# Altium project li-ion-18650-capacity-meter.PrjPcb
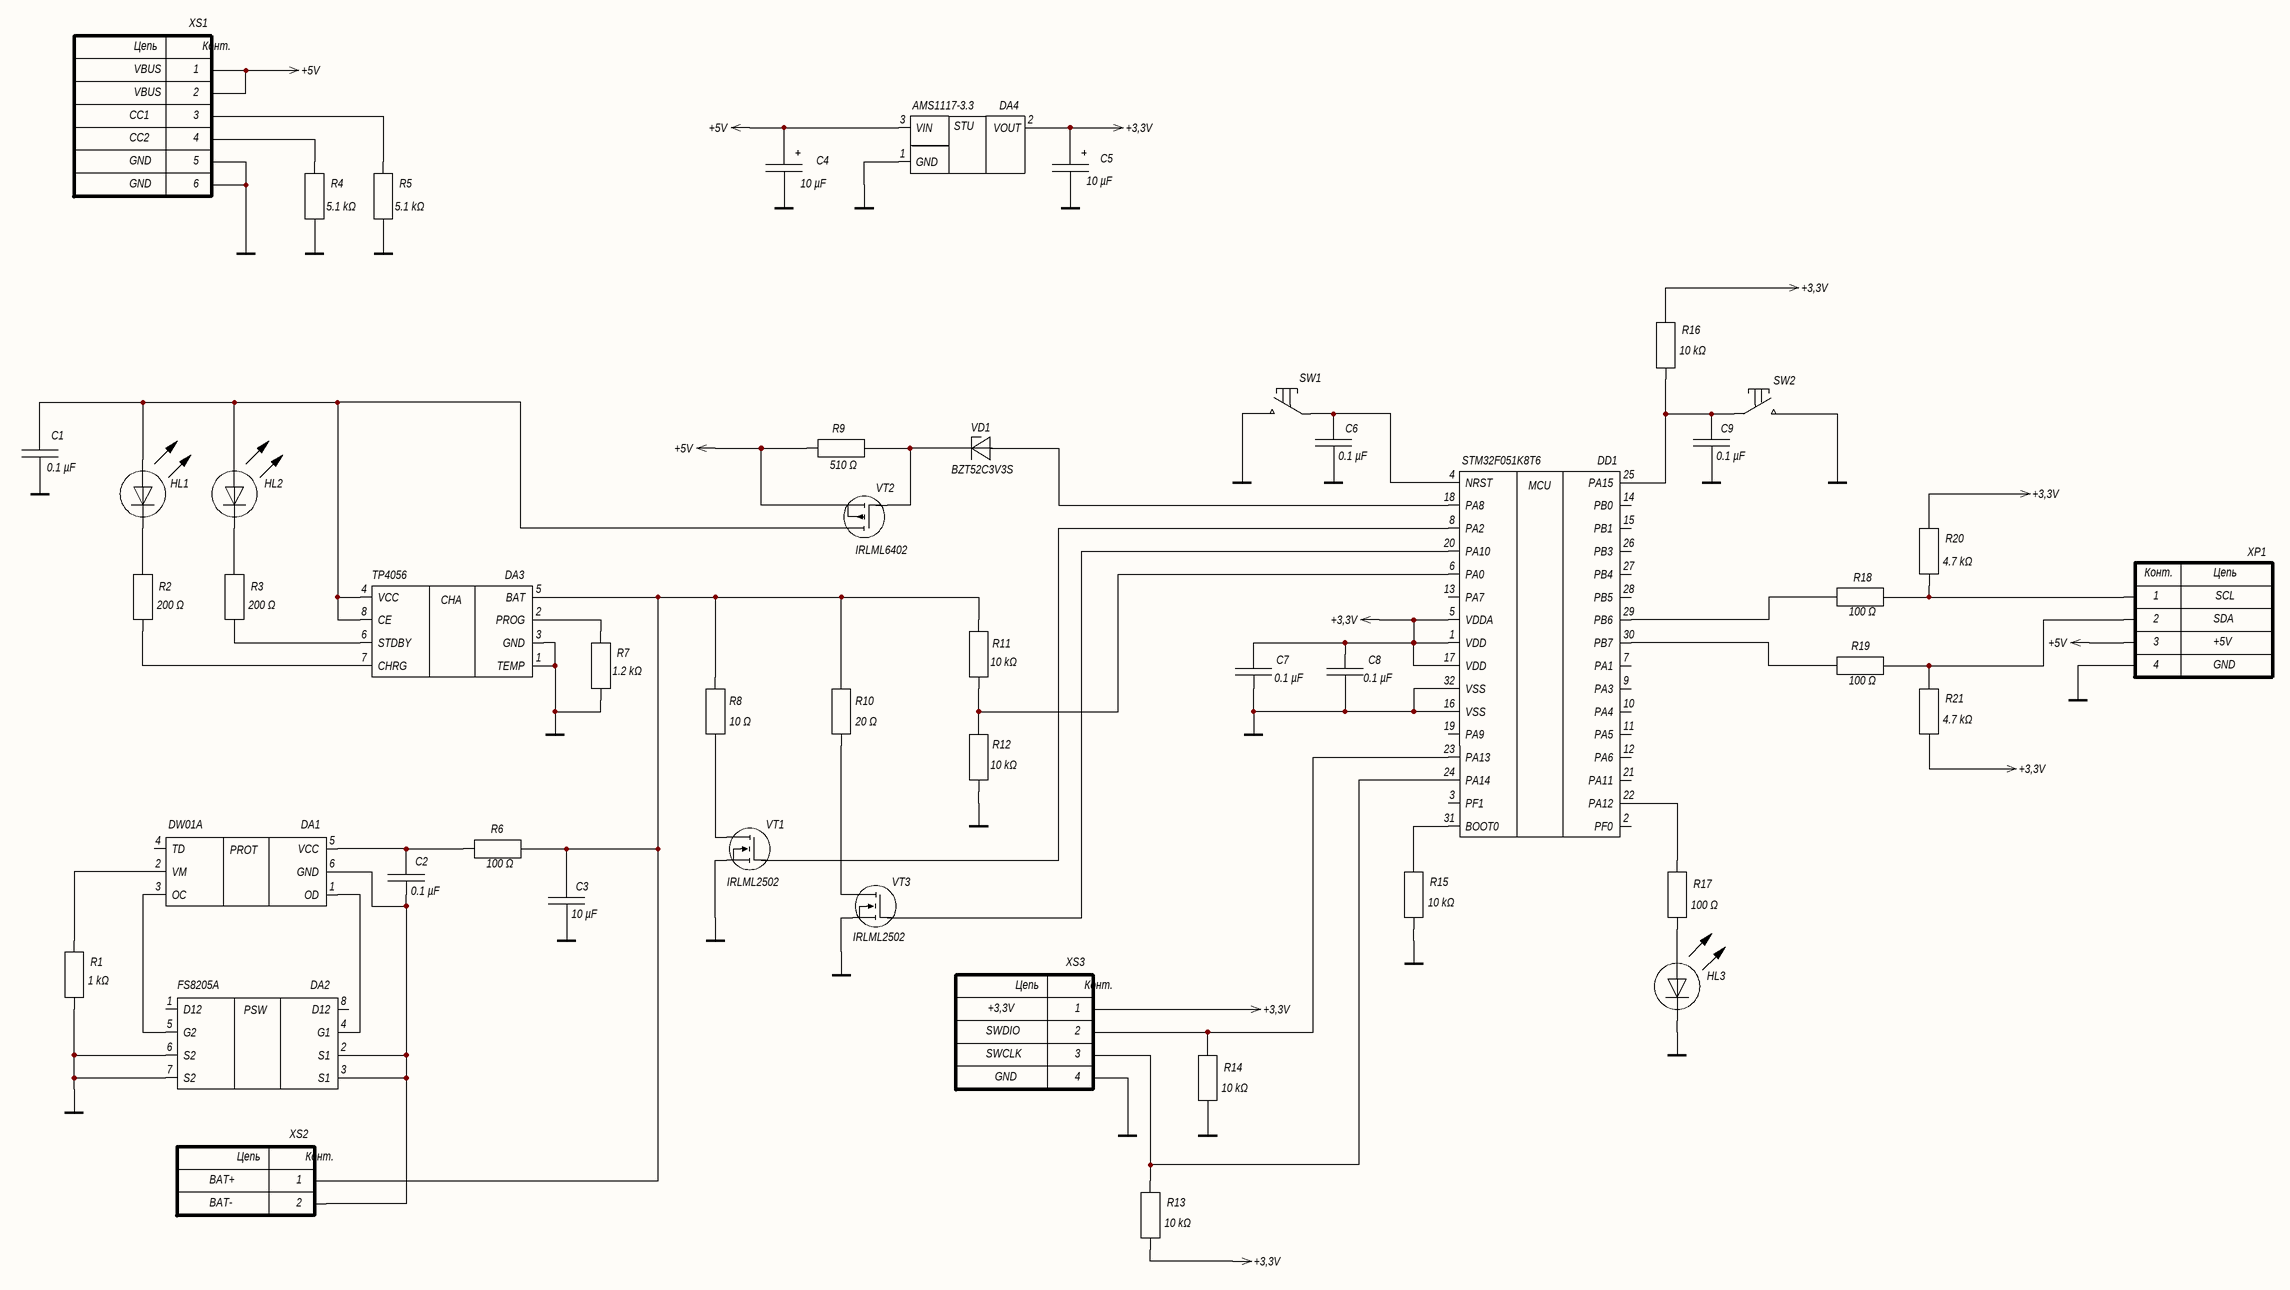
[diagram p0: li-ion-18650-capacity-meter_E3_schematic.SchDoc]
1 sheet, 48 parts. Net scope: global (net labels, ports and power ports of the same name join across sheets).
Board file: li-ion-18650-capacity-meter.PcbDoc

## Sheet li-ion-18650-capacity-meter_E3_schematic.SchDoc: Измеритель емкости
size 594 x 420 mm; CheckedBy: Соловьев В.А.; Author: Советников М.М.; DocumentNumber: ИУ4.11.03.03.26.08.82.18.001 Э3; SheetNumber: 1; SheetTotal: 1; Title2str: Li-Ion аккумуляторов; DocumentType: Схема электрическая принципиальная; Group: Группа ИУ4-82Б; FirstReferrence: ИУ4.11.03.03.26.08.82.18.001

### Parts
C1  0.1 µF  [C_1206]
C2  0.1 µF  [C_1206]
C3  10 µF  [C_1206]
C4  10 µF  [C_ECAP_SMD_4mm]
C5  10 µF  [C_ECAP_SMD_4mm]
C6  0.1 µF  [C_1206]
C7  0.1 µF  [C_1206]
C8  0.1 µF  [C_1206]
C9  0.1 µF  [C_1206]
DA1  DW01A  [DA_SOT-23-6]
DA2  FS8205A  [DA_TSSOP-8_FS8205A]
DA3  TP4056  [DA_TP4056]
DA4  AMS1117-3.3  [DA_SOT-223_AMS1117]
DD1  STM32F051K8T6  [DD_LQFP-32_STM32]
HL1  GNL-3014YD  [HL_LED_Yellow_3mm]  (value not drawn)
HL2  GNL-3014GD  [HL_LED_Green_3mm]  (value not drawn)
HL3  GNL-3014HD  [HL_LED_Red_3mm]  (value not drawn)
R1  1 kΩ  [R_1206]
R2  200 Ω  [R_1206]
R3  200 Ω  [R_1206]
R4  5.1 kΩ  [R_1206]
R5  5.1 kΩ  [R_1206]
R6  100 Ω  [R_1206]
R7  1.2 kΩ  [R_1206]
R8  10 Ω  [R_C2-23]
R9  510 Ω  [R_1206]
R10  20 Ω  [R_C2-23]
R11  10 kΩ  [R_1206]
R12  10 kΩ  [R_1206]
R13  10 kΩ  [R_1206]
R14  10 kΩ  [R_1206]
R15  10 kΩ  [R_1206]
R16  10 kΩ  [R_1206]
R17  100 Ω  [R_1206]
R18  100 Ω  [R_1206]
R19  100 Ω  [R_1206]
R20  4.7 kΩ  [R_1206]
R21  4.7 kΩ  [R_1206]
SW1  IT-1181A  [SW_Button_SMD]  (value not drawn)
SW2  PLS-2R  [PBS-2]  (value not drawn)
VD1  BZT52C3V3S  [VD_SOD-323]
VT1  IRLML2502  [VT_SOT-23]
VT2  IRLML6402  [VT_SOT-23]
VT3  IRLML2502  [VT_SOT-23]
XP1  B4B-XH-A  [X_XH_4Pin_2.54mm]  (value not drawn)
XS1  USB-C-6Pin  [X_USB-C_6Pin]  (value not drawn)
XS2  Battery 18650  [X_KLS5_18650_D]  (value not drawn)
XS3  PLS-4  [X_Arduino_4Pin]  (value not drawn)

### Nets
+3,3V: C5.2 C7.2 C8.2 DA4.2(VOUT) DD1.1(VDD) DD1.5(VDDA) DD1.17(VDD) R13.1 R16.2 R20.2 R21.1 XS3.1
+5V: C4.2 DA4.3(VIN) R9.1 VT2.1(И) XP1.3 XS1.C2 XS1.C5
GND: C1.2 C3.1 C4.1 C5.1 C6.1 C7.1 C8.1 C9.1 DA2.6(S2) DA2.7(S2) DA3.1(TEMP) DA3.3(GND) DA4.1(GND) DD1.16(VSS) DD1.32(VSS) HL3.2 R1.1 R4.1 R5.1 R7.1 R12.1 R14.1 R15.1 SW1.2 SW2.2 VT1.1(И) VT3.1(И) XP1.4 XS1.C1 XS1.C6 XS3.4
NetC1_1: C1.1 DA3.4(VCC) DA3.8(CE) HL1.1 HL2.1 VT2.3(С)
NetC2_1: C2.1 DA1.6(GND) DA2.2(S1) DA2.3(S1) XS2.2
NetC2_2: C2.2 DA1.5(VCC) R6.1
NetC3_2: C3.2 DA3.5(BAT) R6.2 R8.2 R10.2 R11.2 XS2.1
NetC6_2: C6.2 DD1.4(NRST) SW1.1
NetC9_2: C9.2 DD1.25(PA15) R16.1 SW2.1
NetDA1_1: DA1.1(OD) DA2.4(G1)
NetDA1_2: DA1.2(VM) R1.2
NetDA1_3: DA1.3(OC) DA2.5(G2)
NetDA3_2: DA3.2(PROG) R7.2
NetDA3_6: DA3.6(STDBY) R3.1
NetDA3_7: DA3.7(CHRG) R2.1
NetDD1_6: DD1.6(PA0) R11.1 R12.2
NetDD1_8: DD1.8(PA2) VT1.2(З)
NetDD1_18: DD1.18(PA8) VD1.1
NetDD1_20: DD1.20(PA10) VT3.2(З)
NetDD1_22: DD1.22(PA12) R17.2
NetDD1_23: DD1.23(PA13) R14.2 XS3.2
NetDD1_24: DD1.24(PA14) R13.2 XS3.3
NetDD1_29: DD1.29(PB6) R18.1
NetDD1_30: DD1.30(PB7) R19.1
NetDD1_31: DD1.31(BOOT0) R15.2
NetHL1_2: HL1.2 R2.2
NetHL2_2: HL2.2 R3.2
NetHL3_1: HL3.1 R17.1
NetR4_2: R4.2 XS1.C4
NetR5_2: R5.2 XS1.C3
NetR8_1: R8.1 VT1.3(С)
NetR9_2: R9.2 VD1.2 VT2.2(З)
NetR10_1: R10.1 VT3.3(С)
NetR18_2: R18.2 R20.1 XP1.1
NetR19_2: R19.2 R21.2 XP1.2

Not connected (* = marked no-connect by the designer): DA1 4(TD); DA2 1(D12) 8(D12); DD1 2(PF0) 3(PF1) 7(PA1) 9(PA3) 10(PA4) 11(PA5) 12(PA6) 13(PA7) 14(PB0) 15(PB1) 19(PA9) 21(PA11) 26(PB3) 27(PB4) 28(PB5)

### Notes on the sheet
- +5V
- SDA
- SCL
- GND
- SWCLK
- SWDIO
- +3,3V
- BAT+
- BAT-
- Перв.примен.
- Справ.№
- Подп. и дата
- Инв.№ дубл.
- Взам.инв.№
- Подп.и дата
- Разраб.
- Изм.
- Лист
- № докум.
- Подп.
- Дата
- Лит.
- Масштаб
- Масса
- Т.контр.
- Пров.
- Листов
- Инв.№ подл.
- Утв.
- Н.контр.
- Нач.сект.
- Кафедра ИУ4
- МГТУ им. Н.Э. Баумана
- Копировал
- Формат А2
- (in symbol DA_AMS1117) STU
- (in symbol DA_DW01A) PROT
- (in symbol DA_FS8205A) PSW
- (in symbol DA_TP4056) CHA
- (in symbol DD_STM32_LQFP32) MCU
- (in symbol XP_Connector_4Pin) Конт.; Цепь
- (in symbol XS_Connector_2Pin) Цепь; Конт.
- (in symbol XS_Connector_4Pin) Цепь; Конт.
- (in symbol XS_USB-C) Цепь; Конт.; VBUS; 1; 2; CC1; 3; CC2; 4; GND; 5; 6

### Library data of the parts
C1-C3 C6-C9 = C_NonPolarized: Multilayer ceramic capacitor, 10% tolerance
  C1 C2 C6-C9: Value: 0.1 µF
  C3: Value: 10 µF
C4 C5 = C_Polarized: Polarized electrolytic capacitor, 10 µF, 16 V, 20% tolerance; Value: 10 µF
DA1 = DA_DW01A: Single-cell Li-ion battery protection controller; Value: DW01A
DA2 = DA_FS8205A: Dual N-channel power MOSFET; Value: FS8205A
DA3 = DA_TP4056: Single-cell linear Li-ion battery charger with charge-status outputs; Value: TP4056
DA4 = DA_AMS1117: Fixed-output linear voltage regulator, 3.3 V; Value: AMS1117-3.3
DD1 = DD_STM32_LQFP32: 32-bit Arm Cortex-M0 microcontroller, 48 MHz, 64 KB Flash; Value: STM32F051K8T6
HL1 = HL_LED: Yellow LED 3mm; Value: GNL-3014YD
HL2 = HL_LED: Green LED 3mm; Value: GNL-3014GD
HL3 = HL_LED: Red LED 3mm; Value: GNL-3014HD
R1-R7 R9 R11-R21 = R_Resistor: Fixed resistor 0.25W
  R1: Value: 1 kΩ
  R2 R3: Value: 200 Ω
  R4 R5: Value: 5.1 kΩ
  R6 R17-R19: Value: 100 Ω
  R7: Value: 1.2 kΩ
  R9: Value: 510 Ω
  R11-R16: Value: 10 kΩ
  R20 R21: Value: 4.7 kΩ
R8 R10 = R_Resistor: Fixed resistor 2W
  R8: Value: 10 Ω
  R10: Value: 20 Ω
SW1 = SW_Switch: Two-terminal switch internal; Value: IT-1181A
SW2 = SW_Switch: Two-terminal switch external; Value: PLS-2R
VD1 = VD_Zener: Zener diode, 3.3 V, 0.2 W; Value: BZT52C3V3S
VT1 VT3 = VT_MOSFET-N: N-channel power MOSFET, 20 V; Value: IRLML2502
VT2 = VT_MOSFET-P: P-channel power MOSFET, -20 V; Value: IRLML6402
XP1 = XP_Connector_4Pin: 4-position plug connector; Value: B4B-XH-A
XS1 = XS_USB-C: USB Type-C power receptacle, 6 contacts; Value: USB-C-6Pin
XS2 = XS_Connector_2Pin: Single-cell 18650 battery holder; Value: Battery 18650
XS3 = XS_Connector_4Pin: 4-position socket connector; Value: PLS-4